# Altium project Cyborg_greenC_LED_RGB.PrjPcb
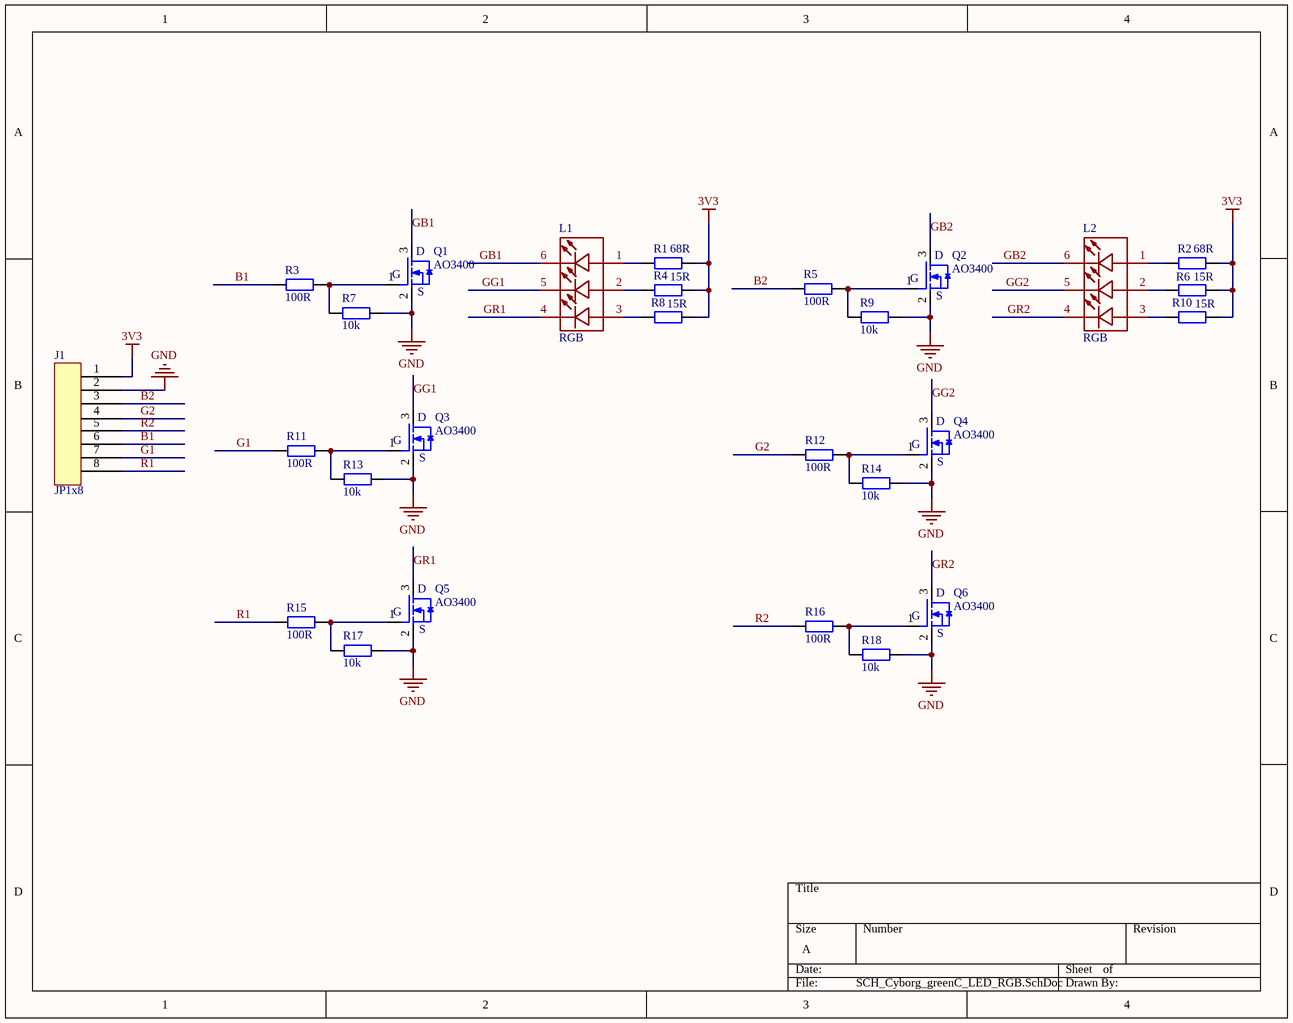
[diagram p0: SCH_Cyborg_greenC_LED_RGB.SchDoc]
1 sheet, 27 parts. Net scope: global (net labels, ports and power ports of the same name join across sheets).
Board file: PCB_Cyborg_greenC_LED_RGB.PcbDoc

## Sheet SCH_Cyborg_greenC_LED_RGB.SchDoc
size A; SheetNumber: 1; SheetTotal: 1

### Parts
J1  JP1x8  [JP1X8 1.27mm]
L1  RGB  [LED-ARRAY-SMD_6P-L5.0-W5.0-TL-RD_XL-5050RGBC-MS - duplicate]
L2  RGB  [LED-ARRAY-SMD_6P-L5.0-W5.0-TL-RD_XL-5050RGBC-MS - duplicate]
Q1  AO3400  [SOT23]
Q2  AO3400  [SOT23]
Q3  AO3400  [SOT23]
Q4  AO3400  [SOT23]
Q5  AO3400  [SOT23]
Q6  AO3400  [SOT23]
R1  68R  [tro smd 0603]
R2  68R  [tro smd 0603]
R3  100R  [tro smd 0603]
R4  15R  [tro smd 0603]
R5  100R  [tro smd 0603]
R6  15R  [tro smd 0603]
R7  10k  [tro smd 0603]
R8  15R  [tro smd 0603]
R9  10k  [tro smd 0603]
R10  15R  [tro smd 0603]
R11  100R  [tro smd 0603]
R12  100R  [tro smd 0603]
R13  10k  [tro smd 0603]
R14  10k  [tro smd 0603]
R15  100R  [tro smd 0603]
R16  100R  [tro smd 0603]
R17  10k  [tro smd 0603]
R18  10k  [tro smd 0603]

### Nets
3V3: J1.1 R1.2 R2.2 R4.2 R6.2 R8.2 R10.2
GND: J1.2 Q1.2 Q2.2 Q3.2 Q4.2 Q5.2 Q6.2 R7.2 R9.2 R13.2 R14.2 R17.2 R18.2
B1: J1.6 R3.1
B2: J1.3 R5.1
G1: J1.7 R11.1
G2: J1.4 R12.1
GB1: L1.6(K) Q1.3
GB2: L2.6(K) Q2.3
GG1: L1.5(K) Q3.3
GG2: L2.5(K) Q4.3
GR1: L1.4(K) Q5.3
GR2: L2.4(K) Q6.3
R1: J1.8 R15.1
R2: J1.5 R16.1
NetL1_1: L1.1(A) R1.1
NetL1_2: L1.2(A) R4.1
NetL1_3: L1.3(A) R8.1
NetL2_1: L2.1(A) R2.1
NetL2_2: L2.2(A) R6.1
NetL2_3: L2.3(A) R10.1
NetQ1_1: Q1.1 R3.2 R7.1
NetQ2_1: Q2.1 R5.2 R9.1
NetQ3_1: Q3.1 R11.2 R13.1
NetQ4_1: Q4.1 R12.2 R14.1
NetQ5_1: Q5.1 R15.2 R17.1
NetQ6_1: Q6.1 R16.2 R18.1

### Notes on the sheet
- (in symbol MOSFET N_Channel) D; G; S

### Library data of the parts
J1 = JP1x8: 1.27mm
L1 L2 = RGB: SMD
Q1-Q6 = MOSFET N_Channel
R1-R18 = Tro 0603 1% 0R: Dán; Don_Vi: Con; So_Chan: 2; Ten_Linh_Kien: Trở 0603 1% 0R; Ma_Hang: MH005792; Chung_Loai: Dán; Kieu_Chan: *